# Altium schematic sheet BasicDiscreteOpAmp.SchDoc
size A4; SheetNumber: 2; SheetTotal: 4
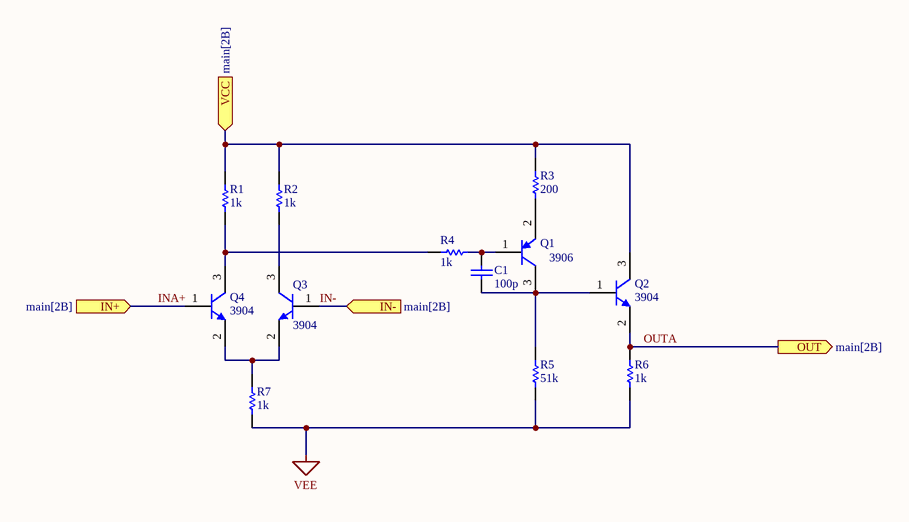
[diagram p0: BasicDiscreteOpAmp.SchDoc]

## Parts
C1  100p  [CAPC2013X145X48ML20T23]
Q1  3906  [ONSC-SOT-23-3-318-08_V]
Q2  3904  [ONSC-SOT-23-3-318-08_V]
Q3  3904  [ONSC-SOT-23-3-318-08_V]
Q4  3904  [ONSC-SOT-23-3-318-08_V]
R1  1k  [RESC2013X50X30ML20T20]
R2  1k  [RESC2013X50X30ML20T20]
R3  200  [RESC2013X50X30ML20T20]
R4  1k  [RESC2013X50X30ML20T20]
R5  51k  [RESC2013X50X30ML20T20]
R6  1k  [RESC2013X50X30ML20T20]
R7  1k  [RESC2013X50X30ML20T20]

## Ports
IN+ (in, see main[2B]), IN- (in, see main[2B]), OUT (out, see main[2B]), VCC (in, see main[2B])

## Nets
VEE: R5.1 R6.1 R7.1
IN-: Q3.1(B) ; port IN-
INA+: Q4.1(B) ; port IN+
OUTA: Q2.2(E) R6.2 ; port OUT
VCC: Q2.3(C) R1.2 R2.2 R3.2 ; port VCC
NetC1_1: C1.1 Q1.3(C) Q2.1(B) R5.2
NetC1_2: C1.2 Q1.1(B) R4.1
NetQ1_2: Q1.2(E) R3.1
NetQ3_2: Q3.2(E) Q4.2(E) R7.2
NetQ3_3: Q3.3(C) R2.1
NetQ4_3: Q4.3(C) R1.1 R4.2

## Library data of the parts
C1 = CMP-2007-01701-1: Manufacturer: Vitramon; Part Number: VJ0805A101KXAAC
Q1 = CMP-1048-00670-1: General Purpose Transistor, PNP Silicon, 3-Pin SOT-23, Pb-Free, Tape and Reel; PartNumber: MMBT3906LT1G; Manufacturer: On Semiconductor; IC Continuous (A): -0.2; fT Min (MHz): 250; PackageDescription: 3-Pin Small Outline Transistor, Body 2.92 x 1.3 mm, Pitch 0.95 mm; Packing: Tape and Reel; ComponentLink3Description: Package Specification; Mounting Technology: Surface Mount; ComponentLink3URL: http://www.onsemi.cn/pub_link/Collateral/318-08.PDF; ComponentLink1URL: http://www.onsemi.com/; ComponentLink2URL: http://www.onsemi.cn/pub_link/Collateral/MMBT3906LT1-D.PDF; PackageReference: SOT-23-3-318-08; Polarity: PNP; ComponentLink2Description: Datasheet; PackageVersion: Rev. AP, 11/2009; RoHS: TRUE; DatasheetVersion: Rev. 11; ComponentLink1Description: Manufacturer URL
Q2-Q4 = CMP-1048-00630-1: General Purpose Transistor, NPN Silicon, 3-Pin SOT-23, Pb-Free, Tape and Reel; Manufacturer: On Semiconductor; PartNumber: MMBT3904LT3G; fT Min (MHz): 300; IC Continuous (A): 0.2; PackageVersion: Rev. AP, 11/2009; PackageReference: SOT-23-3-318-08; Packing: Tape and Reel; RoHS: TRUE; ComponentLink2Description: Datasheet; PackageDescription: 3-Pin Small Outline Transistor, Body 2.92 x 1.3 mm, Pitch 0.95 mm; ComponentLink1Description: Manufacturer URL; ComponentLink3URL: http://www.onsemi.cn/pub_link/Collateral/318-08.PDF; Mounting Technology: Surface Mount; ComponentLink3Description: Package Specification; DatasheetVersion: Rev. 12; ComponentLink1URL: http://www.onsemi.com/; ComponentLink2URL: http://www.onsemi.cn/pub_link/Collateral/MMBT3904LT1-D.PDF; Polarity: NPN
R1-R7 = CMP-2001-03596-1: Part Number: CRCW08051K00FKEB; Manufacturer: Vishay Dale